# EasyEDA Pro project ProProject_F4_2025-05-21.epro, board PCB2
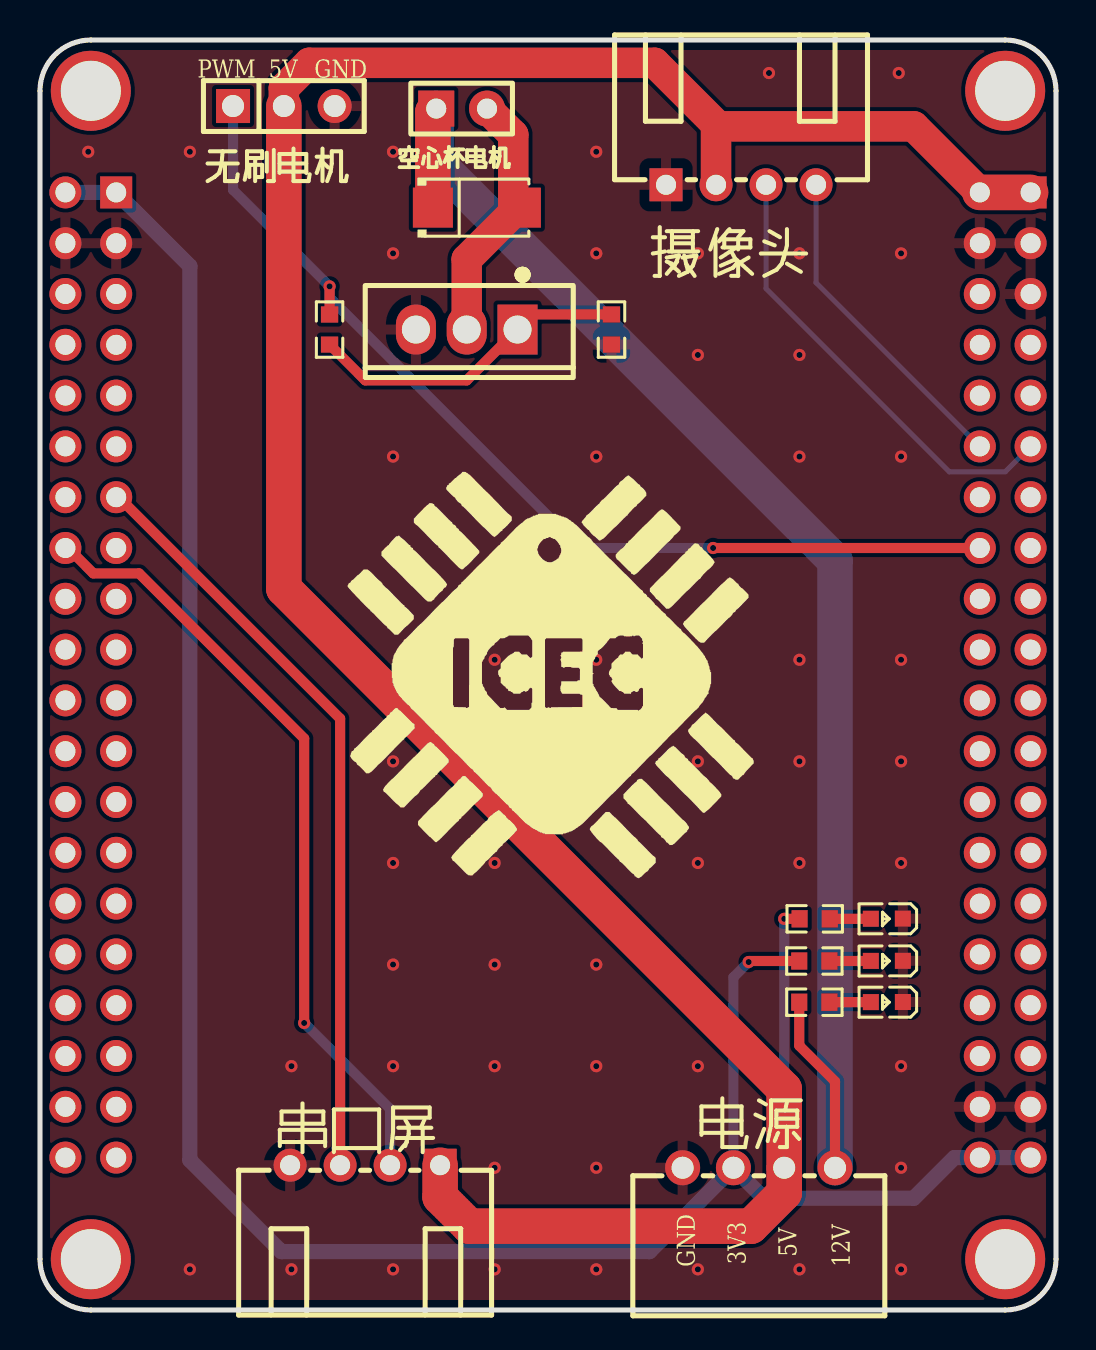
[diagram p4: board, top side]
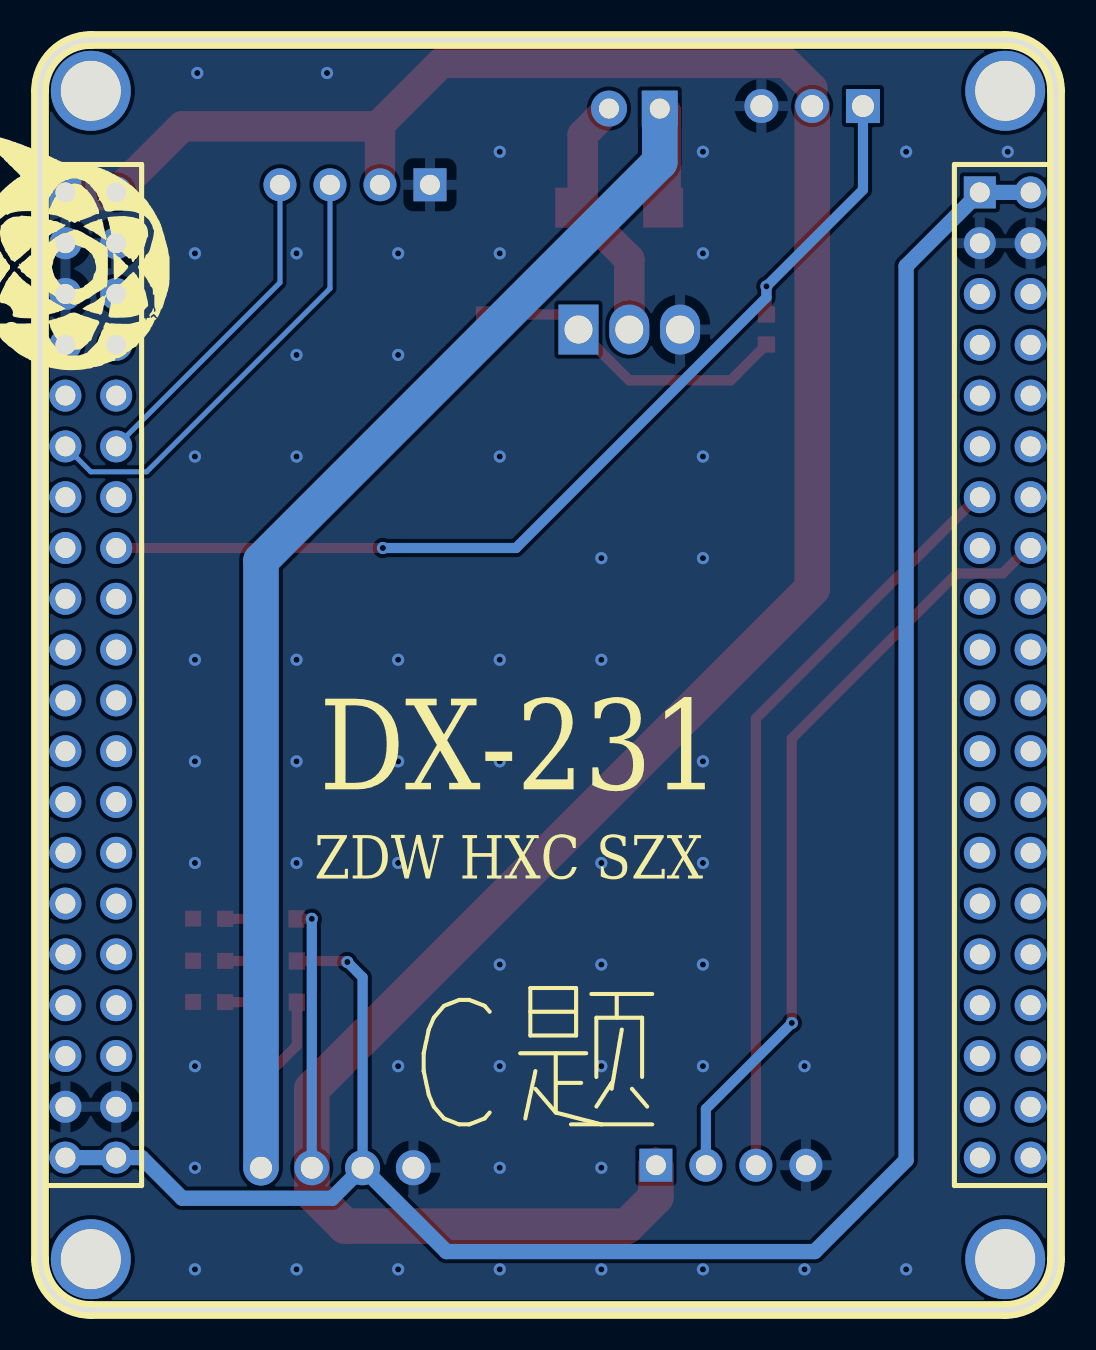
[diagram p5: board, bottom side, seen from below]

Outline 50.8 x 63.5 mm; copper layers: Top Layer, Bottom Layer. Coordinates in mm from the lower left corner of the outline.
Outline path: 0,60.96 0,2.54 arc(0.74,0.74) 2.54,0 48.26,0 arc(50.06,0.74) 50.8,2.54 50.8,60.96 arc(50.06,62.76) 48.26,63.5 2.54,63.5 arc(0.74,62.76) 0,60.96
Stack: Top Layer 0.035mm / Dielectric1 1.51mm FR4 er 4.5 / Bottom Layer 0.035mm

## Design rules (mm)
template: JLCPCB Capability(Two Layers Board)
spacing copperThickness1oz (default): track to track 0.102, other pairs 0.152 to 0.3
spacing copperThickness2oz: track to track 0.203, other pairs 0.152 to 0.3
track width copperThickness1oz (default): min 0.127, default 0.254, max 2.54
track width copperThickness2oz: min 0.203, default 0.254, max 2.54
differential pair differentialPair (default): width min 0.127, default 0.254, max 2.54; gap min 0.152, default 0.152
via viaSize (default): diameter min 0.5, default 0.61, max 10; hole min 0.3, default 0.305, max 6.3

## Placement (name value [footprint] x y rotation side)
CN3  XH-4AW  [CONN-TH_XH-4AW]  35.94 7.11 0 top
H1  -  [HDR-TH_3P-P2.54-V-M]  12.19 60.2 0 top
LED3  -  [LED_0603]  42.29 19.56 180 top
LED4  -  [LED_0603]  42.29 17.45 180 top
LED5  -  [LED_0603]  42.29 15.39 180 top
M1  -  [HDR-TH_2P-P2.54-V-M-1]  21.08 60.07 0 top
NOREF  -  [Pad_e16]  48.26 60.96 0 top
NOREF#2  -  [Pad_e17]  2.54 60.96 0 top
NOREF#3  -  [Pad_e18]  2.54 2.54 0 top
NOREF#4  -  [Pad_e19]  48.26 2.54 0 top
Q1  IRF540N  [TO-220AB-3_L10.4-W4.6-P2.54-L]  21.34 49.02 180 top
R3  10K  [R0603]  38.73 19.56 0 top
R4  10K  [R0603]  38.72 17.45 0 top
R5  10K  [R0603]  38.72 15.39 0 top
R20  电阻  [r0603]  14.48 49.02 270 top
R24  电阻  [r0603]  28.58 49.02 270 top
SS1  HC-XHB-4AW  [CONN-TH_4P-P2.5_HCTL_HC-XHB-4AW]  16.26 7.24 0 top
U1  336682cdb138453f91beae0ae56ac6f0  [F4核心板]  25.4 31.75 0 top
U2  1N4007  [SMA_L4.3-W2.6-LS5.1-RD]  21.84 55.12 0 top
XH1  HC-XHB-4AW  [CONN-TH_4P-P2.5_HCTL_HC-XHB-4AW]  35.05 56.26 180 top

## Footprints (pads in the part's own frame, mm; a bottom-side part is the same pattern mirrored in y, then rotated)
CONN-TH_4P-P2.5_HCTL_HC-XHB-4AW
  rect 1.65x1.65 hole 1: 1(3.75,0)
  round 1.65 hole 1: 2(1.25,0) 3(-1.25,0) 4(-3.75,0)
CONN-TH_XH-4AW
  round 1.75 hole 1.1: 1(-3.81,0) 2(-1.27,0) 3(1.27,0) 4(3.81,0)
F4核心板
  rect 1.6x1.6 hole 1: 1(-21.59,24.13) 41(24.13,24.13)
  round 1.6 hole 1: 2(-24.13,24.13) 3(-21.59,21.59) 4(-24.13,21.59) 5(-21.59,19.05) 6(-24.13,19.05) 7(-21.59,16.51) 8(-24.13,16.51) 9(-21.59,13.97) 10(-24.13,13.97) 11(-21.59,11.43) 12(-24.13,11.43) 13(-21.59,8.89) 14(-24.13,8.89) 15(-21.59,6.35) 16(-24.13,6.35) 17(-21.59,3.81) 18(-24.13,3.81) 19(-21.59,1.27) 20(-24.13,1.27) 21(-21.59,-1.27) 22(-24.13,-1.27) 23(-21.59,-3.81) 24(-24.13,-3.81) 25(-21.59,-6.35) 26(-24.13,-6.35) 27(-21.59,-8.89) 28(-24.13,-8.89) 29(-21.59,-11.43) 30(-24.13,-11.43) 31(-21.59,-13.97) 32(-24.13,-13.97) 33(-21.59,-16.51) 34(-24.13,-16.51) 35(-21.59,-19.05) 36(-24.13,-19.05) 37(-21.59,-21.59) 38(-24.13,-21.59) 39(-21.59,-24.13) 40(-24.13,-24.13) 42(21.59,24.13) 43(24.13,21.59) 44(21.59,21.59) 45(24.13,19.05) 46(21.59,19.05) 47(24.13,16.51) 48(21.59,16.51) 49(24.13,13.97) 50(21.59,13.97) 51(24.13,11.43) 52(21.59,11.43) 53(24.13,8.89) 54(21.59,8.89) 55(24.13,6.35) 56(21.59,6.35) 57(24.13,3.81) 58(21.59,3.81) 59(24.13,1.27) 60(21.59,1.27) 61(24.13,-1.27) 62(21.59,-1.27) 63(24.13,-3.81) 64(21.59,-3.81) 65(24.13,-6.35) 66(21.59,-6.35) 67(24.13,-8.89) 68(21.59,-8.89) 69(24.13,-11.43) 70(21.59,-11.43) 71(24.13,-13.97) 72(21.59,-13.97) 73(24.13,-16.51) 74(21.59,-16.51) 75(24.13,-19.05) 76(21.59,-19.05) 77(24.13,-21.59) 78(21.59,-21.59) 79(24.13,-24.13) 80(21.59,-24.13)
HDR-TH_2P-P2.54-V-M-1
  rect 1.8x1.8 hole 1: 1(-1.27,0)
  round 1.8 hole 1: 2(1.27,0)
HDR-TH_3P-P2.54-V-M
  rect 1.7x1.7 hole 1.1: 1(-2.54,0)
  round 1.7 hole 1.1: 2(0,0) 3(2.54,0)
LED_0603
  rect 0.8x0.8 smd: 1(-0.851,-0.01) 2(0.75,-0.005)
Pad_e16
  round 4 hole 3: 0(0,0)
Pad_e17
  round 4 hole 3: 0(0,0)
Pad_e18
  round 4 hole 3: 0(0,0)
Pad_e19
  round 4 hole 3: 0(0,0)
R0603
  rect 0.806x0.864 smd: 1(-0.753,0) 2(0.753,0)
r0603
  rect 0.806x0.864 smd: 1(-0.753,0) 2(0.753,0)
SMA_L4.3-W2.6-LS5.1-RD
  rect 2x2 smd: 1(-2.2,0) 2(2.2,0)
TO-220AB-3_L10.4-W4.6-P2.54-L
  rect 2x2.5 hole 1.4: 1(-2.54,0)
  oval 2x2.5 hole 1.4: 2(0,0) 3(2.54,0)

## Nets
As in the schematic.

Pads without a net: NOREF 0; NOREF#2 0; NOREF#3 0; NOREF#4 0

## Via types
v1: diameter 0.61, hole 0.305, Top Layer to Bottom Layer, 59 vias

## Routing (per net, layer and track width the routed paths; a pad name or vN(x,y) marks a point on that pad's centre or on a via; arc(x,y) is an arc through that point)
3V3: length 112.7
  Top Layer w0.508: v1(35.43,17.4) 35.48,17.45 R4.1
  Bottom Layer w0.508: v1(35.43,17.4) 34.67,16.64 CN3.2
  Bottom Layer w0.762: U1.2 U1.1 7.49,52.2 7.49,7.49 12.07,2.92 30.48,2.92 CN3.2 36.2,5.59 43.69,5.59 45.72,7.62 U1.80 U1.79
5V: length 142.5
  Top Layer w0.508: R3.1 v1(37.21,19.56)
  Top Layer w1.524: H1.2 12.19,61.09 13.46,62.36 30.73,62.36 33.91,59.18 ; 33.91,59.18 33.8,59.18 XH1.2 ; 33.91,59.18 43.69,59.18 U1.42
  Top Layer w1.778: H1.2 12.19,36.07 37.21,11.05 CN3.3 37.21,5.86 35.55,4.19 21.46,4.19 20.01,5.65 SS1.1 ; U1.41 U1.42
  Bottom Layer w0.508: CN3.3 v1(37.21,19.56)
12V: length 75.3
  Top Layer w0.508: CN3.4 39.75,11.43 37.96,13.22 R5.1
  Top Layer w1.778: 19.64,55.12 19.64,59.9 M1.1
  Bottom Layer w1.778: M1.1 19.81,57.4 39.75,37.47 CN3.4
GND:
  vias: v1(2.41,57.91) v1(7.49,57.91) v1(7.49,2.03) v1(12.57,12.19) v1(12.57,2.03) v1(17.65,57.91) v1(17.65,52.83) v1(17.65,42.67) v1(17.65,37.59) v1(17.65,27.43) v1(17.65,22.35) v1(17.65,17.27) v1(17.65,12.19) v1(17.65,2.03) v1(22.73,37.59) v1(22.73,32.51) v1(22.73,22.35) v1(22.73,17.27) v1(22.73,12.19) v1(22.73,7.11) v1(22.73,2.03) v1(27.81,57.91) v1(27.81,52.83) v1(27.81,42.67) v1(27.81,32.51) v1(27.81,27.43) v1(27.81,17.27) v1(27.81,12.19) v1(27.81,7.11) v1(27.81,2.03) v1(32.89,52.83) v1(32.89,47.75) v1(32.89,32.51) v1(32.89,27.43) v1(32.89,22.35) v1(32.89,12.19) v1(32.89,2.03) v1(36.45,61.85) v1(37.97,52.83) v1(37.97,47.75) v1(37.97,42.67) v1(37.97,32.51) v1(37.97,27.43) v1(37.97,22.35) v1(37.97,2.03) v1(42.94,61.85) v1(43.05,52.83) v1(43.05,42.67) v1(43.05,32.51) v1(43.05,27.43) v1(43.05,22.35) v1(43.05,12.19) v1(43.05,7.11) v1(43.05,2.03)
OPMV_RX: length 16.5
  Bottom Layer w0.254: U1.52 38.8,51.37 XH1.4
OPMV_TX: length 22.7
  Bottom Layer w0.254: XH1.3 36.3,51.07 45.47,41.91 48.26,41.91 U1.51
PD5: length 38
  Top Layer w0.508: SS1.3 15.01,29.57 3.94,40.64
PD6: length 38.9
  Top Layer w0.508: 1.4,38.1 2.67,36.83 4.95,36.83 13.21,28.58 v1(13.21,14.35)
  Bottom Layer w0.508: SS1.2 17.51,10.05 v1(13.21,14.35)
PD12: length 50.7
  Top Layer w0.508: R20.1 v1(14.48,51.18) ; v1(33.65,38.1) U1.56
  Bottom Layer w0.508: H1.1 9.65,56.01 v1(14.48,51.18) 14.48,50.62 27,38.1 v1(33.65,38.1)
$1N2654: length 2.1
  Top Layer w0.508: R4.2 41.54,17.45 LED4.2
$1N2658: length 2.1
  Top Layer w0.508: LED3.2 41.54,19.56 R3.2
$1N2670: length 2.1
  Top Layer w0.508: LED5.2 39.48,15.39 R5.2
$1N3391: length 12.6
  Top Layer w1.524: 22.35,60.07 23.66,58.76 23.66,54.86 21.34,52.54 Q1.2
$1N3394: length 16.2
  Top Layer w0.508: R20.2 16.26,46.48 21.34,46.48 Q1.1 24.63,49.78 R24.1

## Copper pours and planes (outline as drawn; the poured copper is in the pictures)
GND on Top Layer: -2.67,66.93 54.61,66.93 54.61,-3.05 -2.67,-3.05
GND on Bottom Layer: -2.03,71.63 51.82,71.63 51.82,-4.44 -2.03,-4.44

## Text on the board
Bottom Silkscreen Layer: ZDW HXC SZX | DX-231 | C题
Top Silkscreen Layer: PWM | 5V | GND | 空心杯电机 | 3V3 | 12V | 无刷电机 | 串口屏 | 摄像头 | 电源
